# Altium schematic sheet 1700-0003_PowerBoard_REV-A_1.SchDoc: 1700-0003_PowerBoard_REV-A
size 885 x 589 mm; DRAWING_DATE: 4/15/2022; DRAWING_TITLE: PQI380 UNIV. INTERFACE BRD; PART_NUMBER: 7000-0303; REV: R12; Origin: Eagle; DWG-CO-NAME: TransTech Systems, Inc.; DWG-DATE: 11-2022; DWG-NUMBER: ____-____; DWG-REV: R-; DWG-TITLE: PQI380+ POWER BOARD SCHEMATIC (v2); SIZE: D; Date: 7/10/2024 1:57:37 PM; SheetNumber: 2; GateName_1: G$1; SymbolName_1: FRAME_D_L; LibraryName: frames; DeviceSetName: FRAME_D_L; GateName_2: G$2; SymbolName_2: DOCFIELD; Sheet: Sheet:
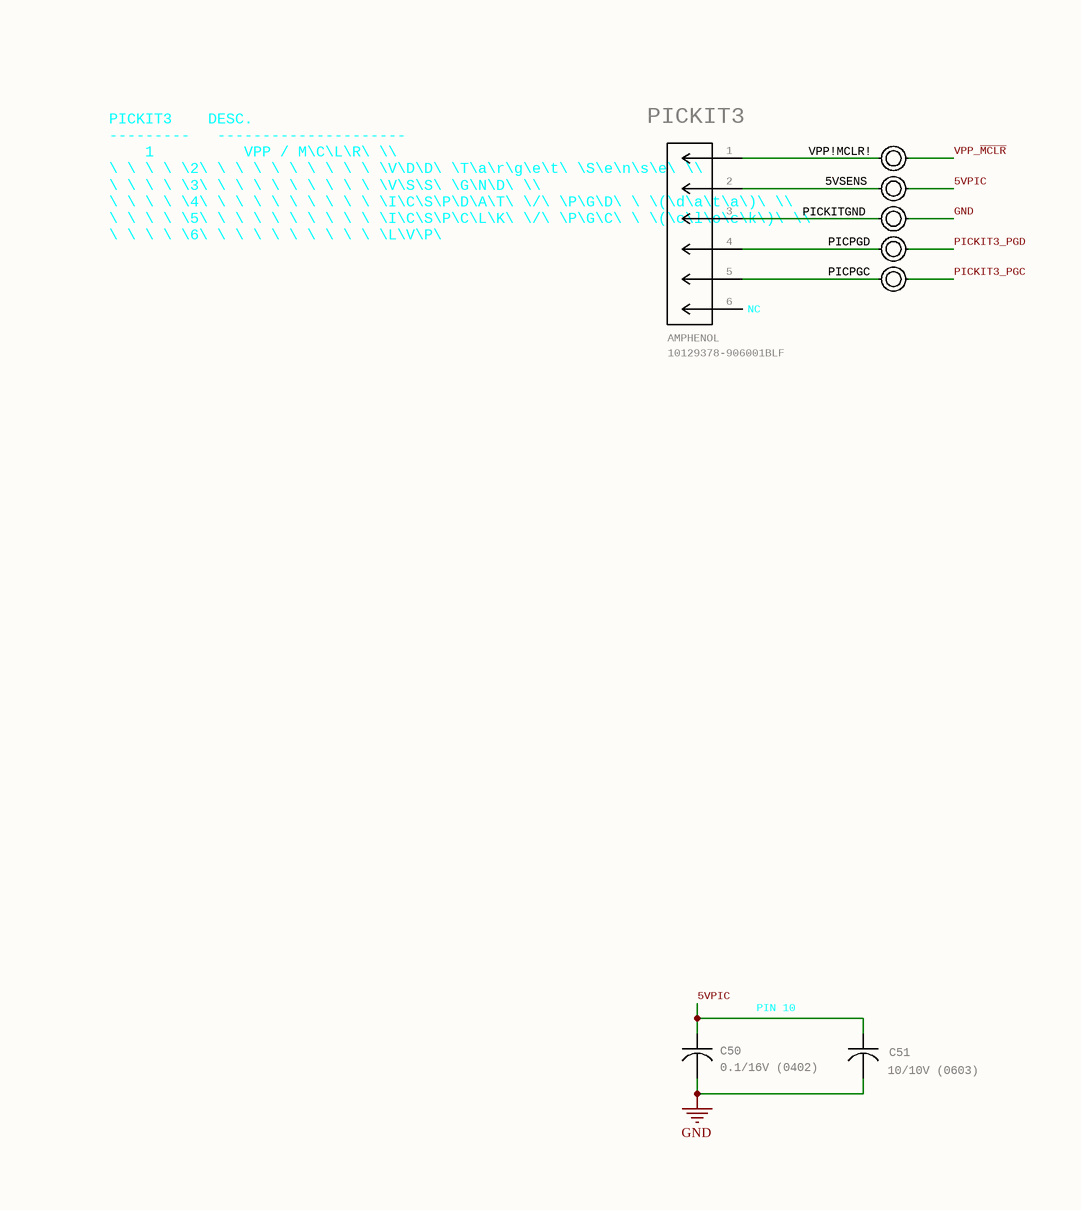
[diagram p0: 1700-0003_PowerBoard_REV-A_1.SchDoc, top left]
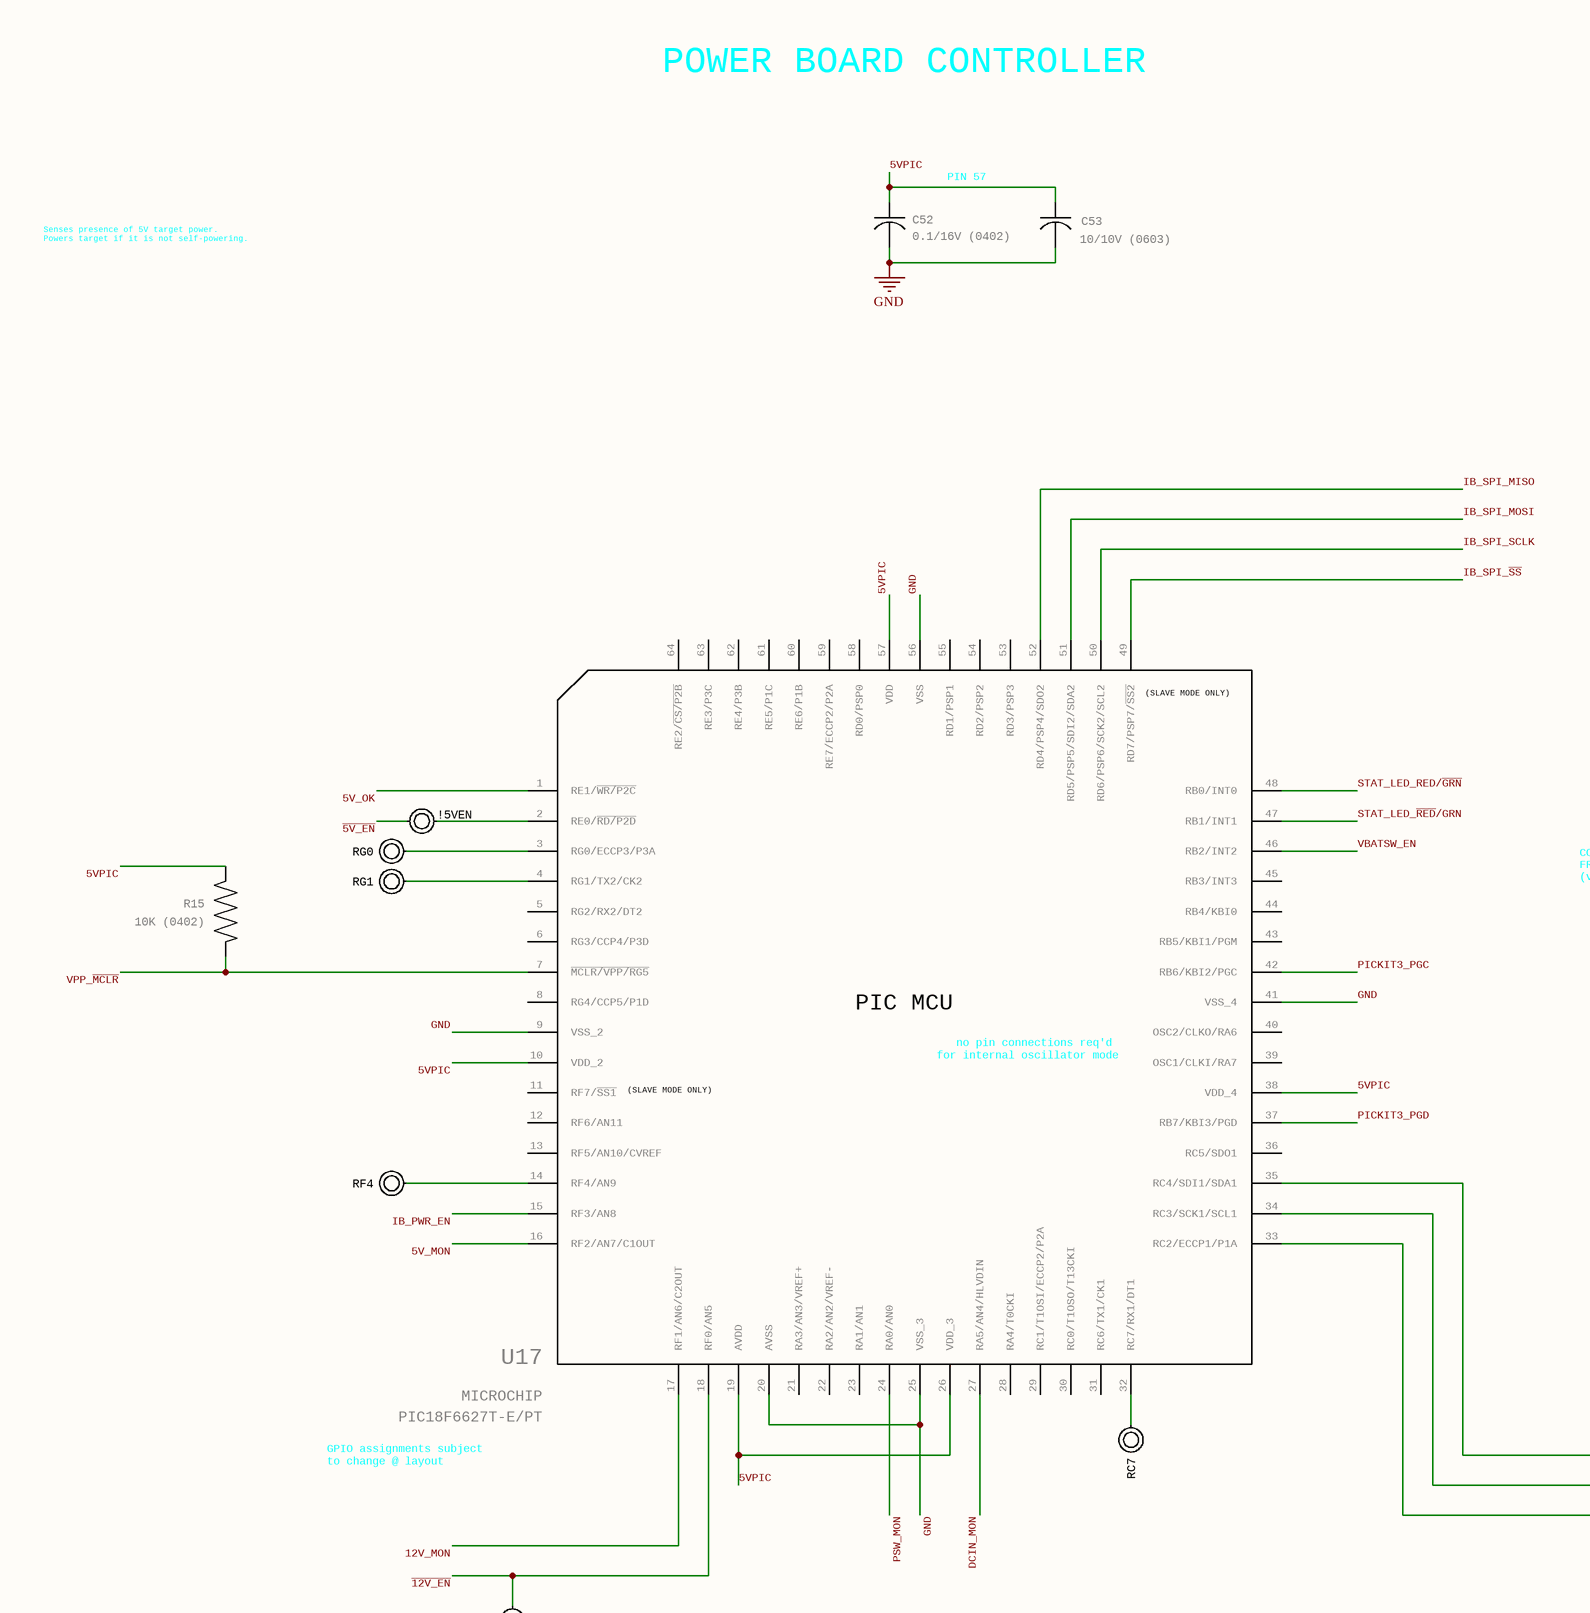
[diagram p1: 1700-0003_PowerBoard_REV-A_1.SchDoc, top middle]
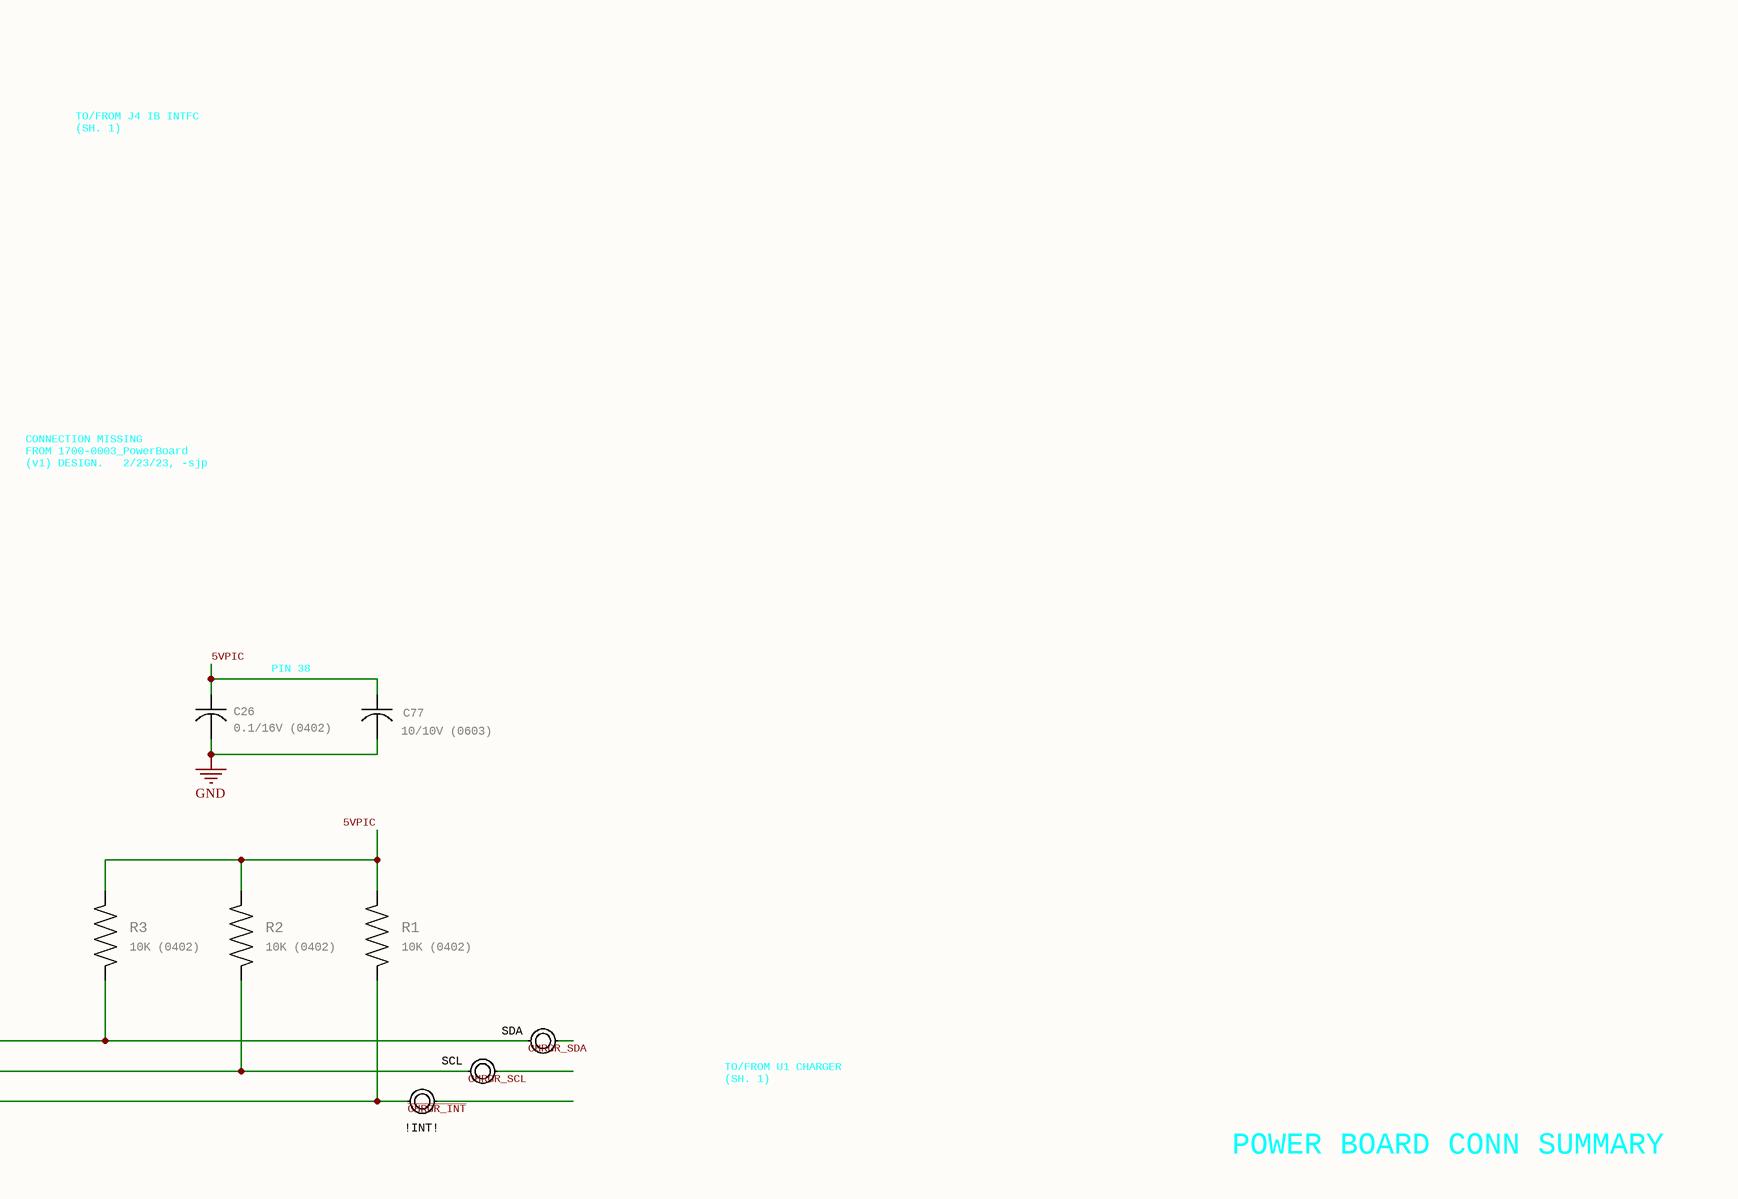
[diagram p2: 1700-0003_PowerBoard_REV-A_1.SchDoc, top right]
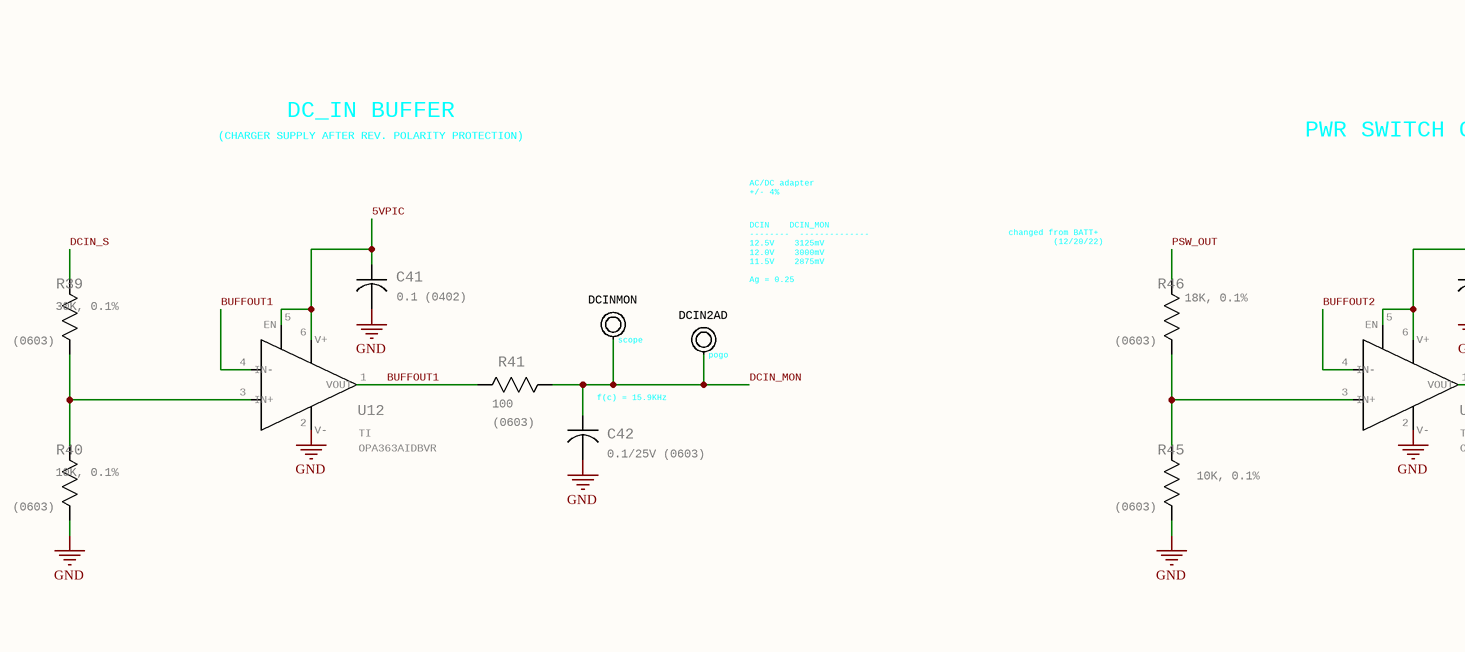
[diagram p3: 1700-0003_PowerBoard_REV-A_1.SchDoc, bottom left]
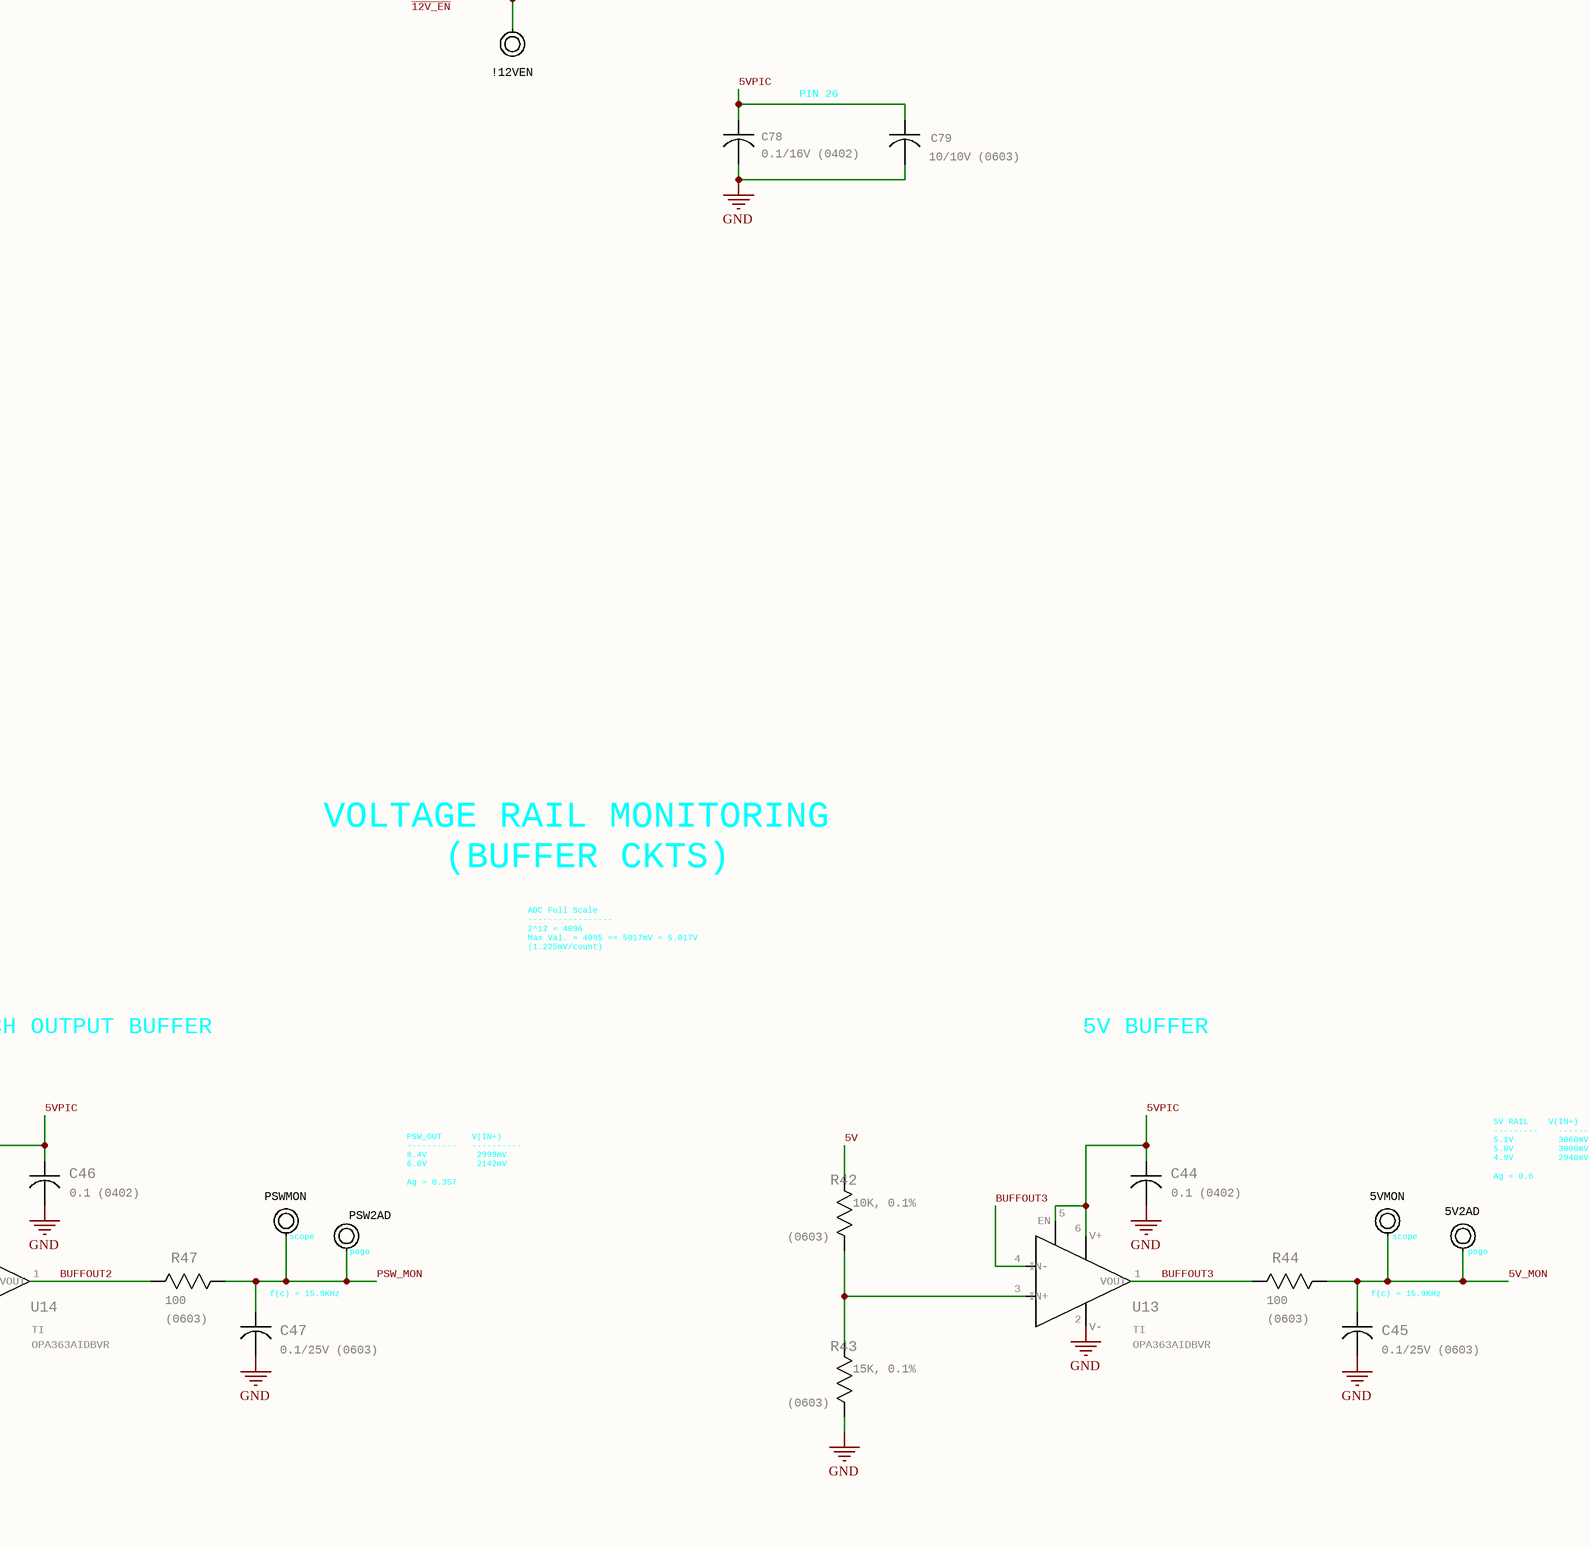
[diagram p4: 1700-0003_PowerBoard_REV-A_1.SchDoc, bottom middle]
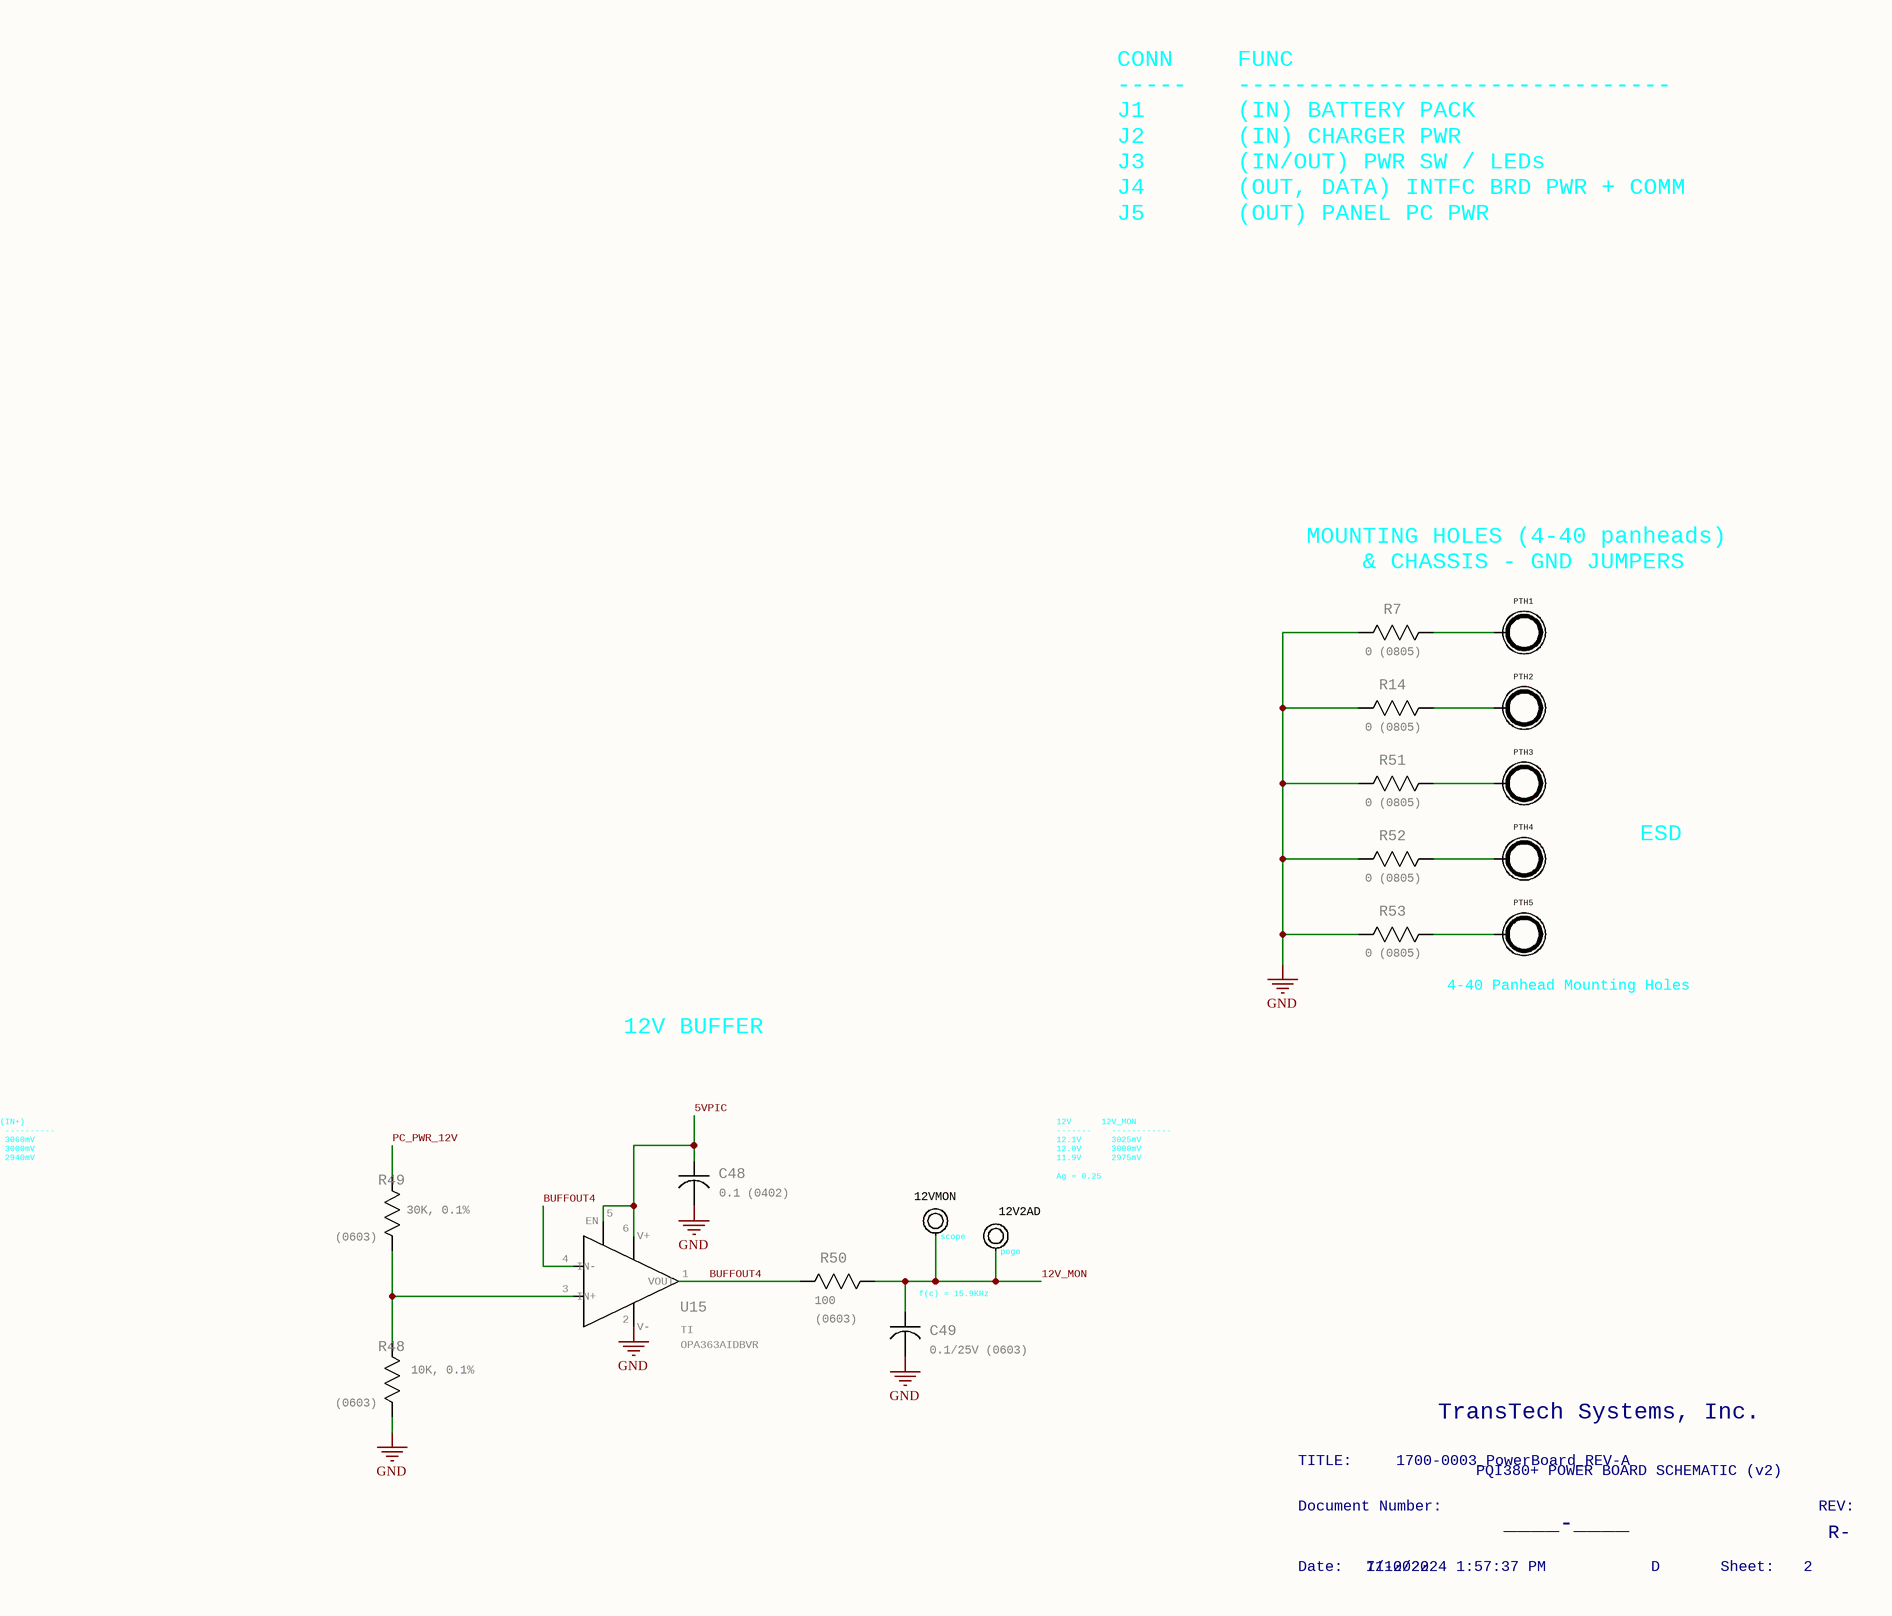
[diagram p5: 1700-0003_PowerBoard_REV-A_1.SchDoc, bottom right]

## Parts
5V2AD  TST_POINT_PTH_20X40MIL  [TST_POINT_PTH_20X40MIL]  (value not drawn)
5VMON  TST_POINT_PTH_042-OCT  [TST_POINT_PTH_042-OCT]  (value not drawn)
5VSENS  TST_POINT_PTH_20X40MIL_2PIN  [TST_POINT_PTH_20X40MIL_2PIN]  (value not drawn)
12V2AD  TST_POINT_PTH_20X40MIL  [TST_POINT_PTH_20X40MIL]  (value not drawn)
12VMON  TST_POINT_PTH_042-OCT  [TST_POINT_PTH_042-OCT]  (value not drawn)
!5VEN  TST_POINT_PTH_20X40MIL_2PIN  [TST_POINT_PTH_20X40MIL_2PIN]  (value not drawn)
!12VEN  TST_POINT_PTH_20X40MIL  [TST_POINT_PTH_20X40MIL]  (value not drawn)
!INT!  TST_POINT_PTH_20X40MIL_2PIN  [TST_POINT_PTH_20X40MIL_2PIN]  (value not drawn)
C26  0.1/16V (0402)  [G-155_MUR]
C41  0.1 (0402)  [G-155_MUR]
C42  0.1/25V (0603)  [CAP_C1608_TDK]
C44  0.1 (0402)  [G-155_MUR]
C45  0.1/25V (0603)  [CAP_C1608_TDK]
C46  0.1 (0402)  [G-155_MUR]
C47  0.1/25V (0603)  [CAP_C1608_TDK]
C48  0.1 (0402)  [G-155_MUR]
C49  0.1/25V (0603)  [CAP_C1608_TDK]
C50  0.1/16V (0402)  [G-155_MUR]
C51  10/10V (0603)  [CAP_C1608_TDK]
C52  0.1/16V (0402)  [G-155_MUR]
C53  10/10V (0603)  [CAP_C1608_TDK]
C77  10/10V (0603)  [CAP_C1608_TDK]
C78  0.1/16V (0402)  [G-155_MUR]
C79  10/10V (0603)  [CAP_C1608_TDK]
DCIN2AD  TST_POINT_PTH_20X40MIL  [TST_POINT_PTH_20X40MIL]  (value not drawn)
DCINMON  TST_POINT_PTH_042-OCT  [TST_POINT_PTH_042-OCT]  (value not drawn)
PICKIT3  MANUFACTURER: AMPHENOL  MANUFACTURER_PART_NUMBER: 10129378-906001BLF  [CON6_1X6_VERT-HDR]  (hidden comment: CON_6POS_VERT-HDR_AMPH_10129378-906001)
PICKITGND  TST_POINT_PTH_20X40MIL_2PIN  [TST_POINT_PTH_20X40MIL_2PIN]  (value not drawn)
PICPGC  TST_POINT_PTH_20X40MIL_2PIN  [TST_POINT_PTH_20X40MIL_2PIN]  (value not drawn)
PICPGD  TST_POINT_PTH_20X40MIL_2PIN  [TST_POINT_PTH_20X40MIL_2PIN]  (value not drawn)
PSW2AD  TST_POINT_PTH_20X40MIL  [TST_POINT_PTH_20X40MIL]  (value not drawn)
PSWMON  TST_POINT_PTH_042-OCT  [TST_POINT_PTH_042-OCT]  (value not drawn)
PTH1  PTH_4-40  [PTH_4-40]  (value not drawn)
PTH2  PTH_4-40  [PTH_4-40]  (value not drawn)
PTH3  PTH_4-40  [PTH_4-40]  (value not drawn)
PTH4  PTH_4-40  [PTH_4-40]  (value not drawn)
PTH5  PTH_4-40  [PTH_4-40]  (value not drawn)
R1  10K (0402)  [RESC1005X35N]
R2  10K (0402)  [RESC1005X35N]
R3  10K (0402)  [RESC1005X35N]
R7  0 (0805)  [STA_HCJ0805_STP]
R14  0 (0805)  [STA_HCJ0805_STP]
R15  10K (0402)  [RESC1005X35N]
R39  30K, 0.1%  PACKAGE: (0603)  [STA_RMCF0603_STP]
R40  10K, 0.1%  PACKAGE: (0603)  [STA_RMCF0603_STP]
R41  100  PACKAGE: (0603)  [STA_RMCF0603_STP]
R42  10K, 0.1%  PACKAGE: (0603)  [STA_RMCF0603_STP]
R43  15K, 0.1%  PACKAGE: (0603)  [STA_RMCF0603_STP]
R44  100  PACKAGE: (0603)  [STA_RMCF0603_STP]
R45  10K, 0.1%  PACKAGE: (0603)  [STA_RMCF0603_STP]
R46  18K, 0.1%  PACKAGE: (0603)  [STA_RMCF0603_STP]
R47  100  PACKAGE: (0603)  [STA_RMCF0603_STP]
R48  10K, 0.1%  PACKAGE: (0603)  [STA_RMCF0603_STP]
R49  30K, 0.1%  PACKAGE: (0603)  [STA_RMCF0603_STP]
R50  100  PACKAGE: (0603)  [STA_RMCF0603_STP]
R51  0 (0805)  [STA_HCJ0805_STP]
R52  0 (0805)  [STA_HCJ0805_STP]
R53  0 (0805)  [STA_HCJ0805_STP]
RC7  TST_POINT_PTH_042-OCT  [TST_POINT_PTH_042-OCT]  (value not drawn)
RF4  TST_POINT_PTH_042-OCT  [TST_POINT_PTH_042-OCT]  (value not drawn)
RG0  TST_POINT_PTH_042-OCT  [TST_POINT_PTH_042-OCT]  (value not drawn)
RG1  TST_POINT_PTH_042-OCT  [TST_POINT_PTH_042-OCT]  (value not drawn)
SCL  TST_POINT_PTH_20X40MIL_2PIN  [TST_POINT_PTH_20X40MIL_2PIN]  (value not drawn)
SDA  TST_POINT_PTH_20X40MIL_2PIN  [TST_POINT_PTH_20X40MIL_2PIN]  (value not drawn)
U12  MANUFACTURER: TI  MANUFACTURER_PART_NUMBER: OPA363AIDBVR  [DBV6]  (hidden comment: IC_OPAMP_TI_OPA363AIDBVR)
U13  MANUFACTURER: TI  MANUFACTURER_PART_NUMBER: OPA363AIDBVR  [DBV6]  (hidden comment: IC_OPAMP_TI_OPA363AIDBVR)
U14  MANUFACTURER: TI  MANUFACTURER_PART_NUMBER: OPA363AIDBVR  [DBV6]  (hidden comment: IC_OPAMP_TI_OPA363AIDBVR)
U15  MANUFACTURER: TI  MANUFACTURER_PART_NUMBER: OPA363AIDBVR  [DBV6]  (hidden comment: IC_OPAMP_TI_OPA363AIDBVR)
U17  PICMCU: PIC MCU  (SLAVEMODEONLY): (SLAVE MODE ONLY)  MANUFACTURER: MICROCHIP  [TQFP64_10X10MC_MCH]  (hidden comment: PIC18F6627T-E/PT)
VPP!MCLR!  TST_POINT_PTH_20X40MIL_2PIN  [TST_POINT_PTH_20X40MIL_2PIN]  (value not drawn)

## Nets
GND: C26.2 C41.2 C42.2 C44.2 C45.2 C46.2 C47.2 C48.2 C49.2 C50.2 C51.2 C52.2 C53.2 C77.2 C78.2 C79.2 PICKITGND.P$1 R7.2 R14.2 R40.2 R43.2 R45.2 R48.2 R51.2 R52.2 R53.2 U12.2(V-) U13.2(V-) U14.2(V-) U15.2(V-) U17.9(VSS_2) U17.20(AVSS) U17.25(VSS_3) U17.41(VSS_4) U17.56(VSS)
~{12V_EN}: !12VEN.P$1 U17.18(RF0/AN5)
~{5V_EN}: !5VEN.P$2
5V: R42.1
5V_MON: 5V2AD.P$1 5VMON.P$1 C45.1 R44.2 U17.16(RF2/AN7/C1OUT)
5V_OK: U17.1(RE1/~{WR/P2C})
5VPIC: 5VSENS.P$1 C26.1 C41.1 C44.1 C46.1 C48.1 C50.1 C51.1 C52.1 C53.1 C77.1 C78.1 C79.1 R1.1 R2.1 R3.1 R15.1 U12.5(EN) U12.6(V+) U13.5(EN) U13.6(V+) U14.5(EN) U14.6(V+) U15.5(EN) U15.6(V+) U17.10(VDD_2) U17.19(AVDD) U17.26(VDD_3) U17.38(VDD_4) U17.57(VDD)
12V_MON: 12V2AD.P$1 12VMON.P$1 C49.1 R50.2 U17.17(RF1/AN6/C2OUT)
BUFFOUT1: R41.1 U12.1(VOUT) U12.4(IN-)
BUFFOUT2: R47.1 U14.1(VOUT) U14.4(IN-)
BUFFOUT3: R44.1 U13.1(VOUT) U13.4(IN-)
BUFFOUT4: R50.1 U15.1(VOUT) U15.4(IN-)
~{CHRGR_INT}: !INT!.P$2 R1.2 U17.33(RC2/ECCP1/P1A)
CHRGR_SCL: R2.2 SCL.P$2 U17.34(RC3/SCK1/SCL1)
CHRGR_SDA: R3.2 SDA.P$2 U17.35(RC4/SDI1/SDA1)
DCIN_MON: C42.1 DCIN2AD.P$1 DCINMON.P$1 R41.2 U17.27(RA5/AN4/HLVDIN)
DCIN_S: R39.1
IB_PWR_EN: U17.15(RF3/AN8)
IB_SPI_MISO: U17.52(RD4/PSP4/SDO2)
IB_SPI_MOSI: U17.51(RD5/PSP5/SDI2/SDA2)
IB_SPI_~{SS}: U17.49(RD7/PSP7/~{SS2})
IB_SPI_SCLK: U17.50(RD6/PSP6/SCK2/SCL2)
PC_PWR_12V: R49.1
PICKIT3_PGC: PICPGC.P$1 U17.42(RB6/KBI2/PGC)
PICKIT3_PGD: PICPGD.P$1 U17.37(RB7/KBI3/PGD)
PSW_MON: C47.1 PSW2AD.P$1 PSWMON.P$1 R47.2 U17.24(RA0/AN0)
PSW_OUT: R46.1
STAT_LED_~{RED}/GRN: U17.47(RB1/INT1)
STAT_LED_RED/~{GRN}: U17.48(RB0/INT0)
VBATSW_EN: U17.46(RB2/INT2)
VPP_~{MCLR}: R15.2 U17.7(~{MCLR/VPP/RG5}) VPP!MCLR!.P$1
Net5VSENS_P$2: 5VSENS.P$2 PICKIT3.2
Net!5VEN_P$1: !5VEN.P$1 U17.2(RE0/~{RD/P2D})
NetPICKIT3_1: PICKIT3.1 VPP!MCLR!.P$2
NetPICKIT3_3: PICKIT3.3 PICKITGND.P$2
NetPICKIT3_4: PICKIT3.4 PICPGD.P$2
NetPICKIT3_5: PICKIT3.5 PICPGC.P$2
NetPTH1_P$1: PTH1.P$1 R7.1
NetPTH2_P$1: PTH2.P$1 R14.1
NetPTH3_P$1: PTH3.P$1 R51.1
NetPTH4_P$1: PTH4.P$1 R52.1
NetPTH5_P$1: PTH5.P$1 R53.1
NetR39_2: R39.2 R40.1 U12.3(IN+)
NetR42_2: R42.2 R43.1 U13.3(IN+)
NetR45_1: R45.1 R46.2 U14.3(IN+)
NetR48_1: R48.1 R49.2 U15.3(IN+)
NetRC7_P$1: RC7.P$1 U17.32(RC7/RX1/DT1)
NetRF4_P$1: RF4.P$1 U17.14(RF4/AN9)
NetRG0_P$1: RG0.P$1 U17.3(RG0/ECCP3/P3A)
NetRG1_P$1: RG1.P$1 U17.4(RG1/TX2/CK2)

Not connected (* = marked no-connect by the designer): !INT! P$1; PICKIT3 6; SCL P$1; SDA P$1; U17 5(RG2/RX2/DT2) 6(RG3/CCP4/P3D) 8(RG4/CCP5/P1D) 11(RF7/~{SS1}) 12(RF6/AN11) 13(RF5/AN10/CVREF) 21(RA3/AN3/VREF+) 22(RA2/AN2/VREF-) 23(RA1/AN1) 28(RA4/T0CKI) 29(RC1/T1OSI/ECCP2/P2A) 30(RC0/T1OSO/T13CKI) 31(RC6/TX1/CK1) 36(RC5/SDO1) 39(OSC1/CLKI/RA7) 40(OSC2/CLKO/RA6) 43(RB5/KBI1/PGM) 44(RB4/KBI0) 45(RB3/INT3) 53(RD3/PSP3) 54(RD2/PSP2) 55(RD1/PSP1) 58(RD0/PSP0) 59(RE7/ECCP2/P2A) 60(RE6/P1B) 61(RE5/P1C) 62(RE4/P3B) 63(RE3/P3C) 64(RE2/~{CS/P2B})

## Notes on the sheet
- POWER BOARD CONTROLLER
- PIN 57
- Senses presence of 5V target power.
  Powers target if it is not self-powering.
- PICKIT3    DESC.
  ---------   ---------------------
  1          VPP / M\C\L\R\ \\
  \ \ \ \ \2\ \ \ \ \ \ \ \ \ \ \V\D\D\ \T\a\r\g\e\t\ \S\e\n\s\e\ \\
  \ \ \ \ \3\ \ \ \ \ \ \ \ \ \ \V\S\S\ \G\N\D\ \\
  \ \ \ \ \4\ \ \ \ \ \ \ \ \ \ \I\C\S\P\D\A\T\ \/\ \P\G\D\ \ \(\d\a\t\a\)\ \\
  \ \ \ \ \5\ \ \ \ \ \ \ \ \ \ \I\C\S\P\C\L\K\ \/\ \P\G\C\ \ \(\c\l\o\c\k\)\ \\
  \ \ \ \ \6\ \ \ \ \ \ \ \ \ \ \L\V\P\
- (near PICKIT3) NC
- TO/FROM J4 IB INTFC
  (SH. 1)
- CONNECTION MISSING
  FROM 1700-0003_PowerBoard
  (v1) DESIGN.   2/23/23, -sjp
- PIN 10
- (near U17) no pin connections req'd
  for internal oscillator mode
- PIN 38
- GPIO assignments subject
  to change @ layout
- TO/FROM U1 CHARGER
  (SH. 1)
- POWER BOARD CONN SUMMARY
- PIN 26
- CONN
  -----
  J1
  J2
  J3
  J4
  J5
- FUNC
  -------------------------------
  (IN) BATTERY PACK
  (IN) CHARGER PWR
  (IN/OUT) PWR SW / LEDs
  (OUT, DATA) INTFC BRD PWR + COMM
  (OUT) PANEL PC PWR
- MOUNTING HOLES (4-40 panheads)
  & CHASSIS - GND JUMPERS
- VOLTAGE RAIL MONITORING
  (BUFFER CKTS)
- ESD
- ADC Full Scale
  -----------------
  2^12 = 4096
  Max Val. = 4095 == 5017mV = 5.017V
  (1.225mV/count)
- DC_IN BUFFER
- (CHARGER SUPPLY AFTER REV. POLARITY PROTECTION)
- PWR SWITCH OUTPUT BUFFER
- 5V BUFFER
- 12V BUFFER
- 4-40 Panhead Mounting Holes
- AC/DC adapter
  +/- 4%
- changed from BATT+
  (12/20/22)
- DCIN    DCIN_MON
  --------  --------------
  12.5V    3125mV
  12.0V    3000mV
  11.5V    2875mV
  Ag = 0.25
- PSW_OUT      V(IN+)
  ----------   ----------
  8.4V          2999mV
  6.0V          2142mV
  Ag = 0.357
- 5V RAIL    V(IN+)
  ---------    ----------
  5.1V         3060mV
  5.0V         3000mV
  4.9V         2940mV
  Ag = 0.6
- 12V      12V_MON
  -------    ------------
  12.1V      3025mV
  12.0V      3000mV
  11.9V      2975mV
  Ag = 0.25
- (near DCINMON) scope
- (near DCIN2AD) pogo
- (near PSWMON) scope
- (near PSW2AD) pogo
- (near 5VMON) scope
- (near 5V2AD) pogo
- (near 12VMON) scope
- (near 12V2AD) pogo
- (near C42) f(c) = 15.9KHz
- f(c) = 15.9KHz
- (near C45) f(c) = 15.9KHz
- TransTech Systems, Inc.
- TITLE:
- Document Number:
- 1700-0003_PowerBoard_REV-A
- PQI380+ POWER BOARD SCHEMATIC (v2)
- REV:
- Date:
- 7/10/2024 1:57:37 PM
- 11-2022
- ____-____
- D
- Sheet:
- 2
- R-

## Library data of the parts
5V2AD 12V2AD !12VEN DCIN2AD PSW2AD = TST_POINT_PTH_20X40MIL: GateName_1: G$1; SymbolName_1: TST_POINT_PTH_042-OCT; LibraryName: TTECH; DeviceSetName: TST_POINT_PTH_20X40MIL
5VMON 12VMON DCINMON PSWMON RC7 RF4 RG0 RG1 = TST_POINT_PTH_042-OCT: PART_DESC: PCB feature, test point, ID 42mil, OD 72mil; GateName_1: G$1; SymbolName_1: TST_POINT_PTH_042-OCT; LibraryName: TTECH; DeviceSetName: TST_POINT_PTH_042-OCT
5VSENS !5VEN !INT! PICKITGND PICPGC PICPGD SCL SDA VPP!MCLR! = TST_POINT_PTH_20X40MIL_2PIN: PART_DESC: PCB FEATURE, TEST POINT, ID 20MIL, OD 40MIL; GateName_1: G$1; SymbolName_1: TST_POINT_PTH_042-OCT-2PIN; LibraryName: TTECH; DeviceSetName: TST_POINT_PTH_20X40MIL_2PIN
C26 C41 C44 C46 C48 C50 C52 C78 = CAP_CER_0402_MURATA: MANUFACTURER: MURATA; MANUFACTURER_PART_NUMBER: GCM155R71C104KA55D; PART_DESC: CAP CER 0.1UF 16V X7R 0402; GateName_1: A; SymbolName_1: CAPH; LibraryName: TTECH; DeviceSetName: CAP_CER_0402_MURATA
C42 C45 C47 C49 = CAP_CER_0603_TDK: MANUFACTURER: KEMET; MANUFACTURER_PART_NUMBER: C0603C104K3RAC7867; PART_DESC: CAP CER 0.1UF 25V X7R 0603; GateName_1: A; SymbolName_1: CAPH; LibraryName: TTECH; DeviceSetName: CAP_CER_0603_TDK
C51 C53 C77 C79 = CAP_CER_0603_TDK: MANUFACTURER: MURATA; MANUFACTURER_PART_NUMBER: GRM188D71A106KA73D; PART_DESC: CAP CER 10UF 10V X7T 0603; GateName_1: A; SymbolName_1: CAPH; LibraryName: TTECH; DeviceSetName: CAP_CER_0603_TDK
PICKIT3 = CON_6POS_VERT-HDR_AMPH_10129378-906001: PART_DESC: Connector Header Through Hole 6 position 0.100" (2.54mm); GateName_1: A; SymbolName_1: CON6_1X6_P100RM_HDR_7; LibraryName: TTECH; DeviceSetName: CON_6POS_VERT-HDR_AMPH_10129378-906001
PTH1-PTH5 = PTH_4-40: PART_DESC: PCB feature, PTH 4-40, ID 148mil, OD 220mil; GateName_1: PTH; SymbolName_1: MNT-HOLE; LibraryName: TTECH; DeviceSetName: PTH_4-40
R1-R3 R15 = RES_0402_VISHAY: RES SMD ... 0402; MANUFACTURER: VISHAY; PART_DESC: RES 10K OHM 1% 1/16W 0402; GateName_1: G$1; SymbolName_1: CRCW040210K0FKEDC; LibraryName: TTECH; DeviceSetName: RES_0402_VISHAY; MANUFACTURER_PART_NUMBER: CRCW040210K0FKEDC
R7 R14 R51-R53 = RES_0805_STACKPOLE: MANUFACTURER_PART_NUMBER: HCJ0805ZT0R00; PART_DESC: RES 0 OHM JUMPER 1/2W 0805; GateName_1: A; SymbolName_1: RES; LibraryName: TTECH; DeviceSetName: RES_0805_STACKPOLE; COPYRIGHT: Copyright (C) 2022 Ultra Librarian. All rights reserved.; MANUFACTURER: STACKPOLE
R39 R49 = RES_0603_STACKPOLE: MANUFACTURER: TECONN; MANUFACTURER_PART_NUMBER: CPF0603B30KE1; PART_DESC: RES SMD 30K OHM 0.1% 1/16W 0603; GateName_1: A; SymbolName_1: RES; LibraryName: TTECH; DeviceSetName: RES_0603_STACKPOLE; COPYRIGHT: Copyright (C) 2022 Ultra Librarian. All rights reserved.
R40 R42 R45 R48 = RES_0603_STACKPOLE: MANUFACTURER_PART_NUMBER: RNCS0603BKE10K0; PART_DESC: RES 10K OHM 0.1% 1/16W 0603; GateName_1: A; SymbolName_1: RES; LibraryName: TTECH; DeviceSetName: RES_0603_STACKPOLE; COPYRIGHT: Copyright (C) 2022 Ultra Librarian. All rights reserved.; MANUFACTURER: STACKPOLE
R41 R44 R47 R50 = RES_0603_STACKPOLE: MANUFACTURER: TECONN; MANUFACTURER_PART_NUMBER: CPF0603F100RC1; PART_DESC: RES SMD 100 OHM 1% 1/16W 0603; GateName_1: A; SymbolName_1: RES; LibraryName: TTECH; DeviceSetName: RES_0603_STACKPOLE; COPYRIGHT: Copyright (C) 2022 Ultra Librarian. All rights reserved.
R43 = RES_0603_STACKPOLE: MANUFACTURER: TECONN; MANUFACTURER_PART_NUMBER: CPF0603B15KE1; PART_DESC: RES SMD 15K OHM 0.1% 1/16W 0603; GateName_1: A; SymbolName_1: RES; LibraryName: TTECH; DeviceSetName: RES_0603_STACKPOLE; COPYRIGHT: Copyright (C) 2022 Ultra Librarian. All rights reserved.
R46 = RES_0603_STACKPOLE: MANUFACTURER: TECONN; MANUFACTURER_PART_NUMBER: CPF0603B18KE1; PART_DESC: RES SMD 18K OHM 0.1% 1/16W 0603; GateName_1: A; SymbolName_1: RES; LibraryName: TTECH; DeviceSetName: RES_0603_STACKPOLE; COPYRIGHT: Copyright (C) 2022 Ultra Librarian. All rights reserved.
U12-U15 = IC_OPAMP_TI_OPA363AIDBVR: PART_DESC: IC OPAMP GP 1 CIRCUIT SOT23-6; GateName_1: A; SymbolName_1: OPA363_DBV_6; LibraryName: TTECH; DeviceSetName: IC_OPAMP_TI_OPA363AIDBVR; COPYRIGHT: Copyright (C) 2022 Ultra Librarian. All rights reserved.; PACKAGE: (SOT23-6)
U17 = PIC18F6627T-E/PT: PART_DESC: IC MCU 8BIT 96KB FLASH 64TQFP; GateName_1: A; SymbolName_1: PIC18F6627-X/PT; LibraryName: TTECH; DeviceSetName: PIC18F6627T-E/PT; MANUFACTURER_PART_NUMBER: PIC18F6627T-E/PT